# Altium schematic sheet HDMI_Sink.SchDoc
size A4; SheetNumber: 6; SheetTotal: 13
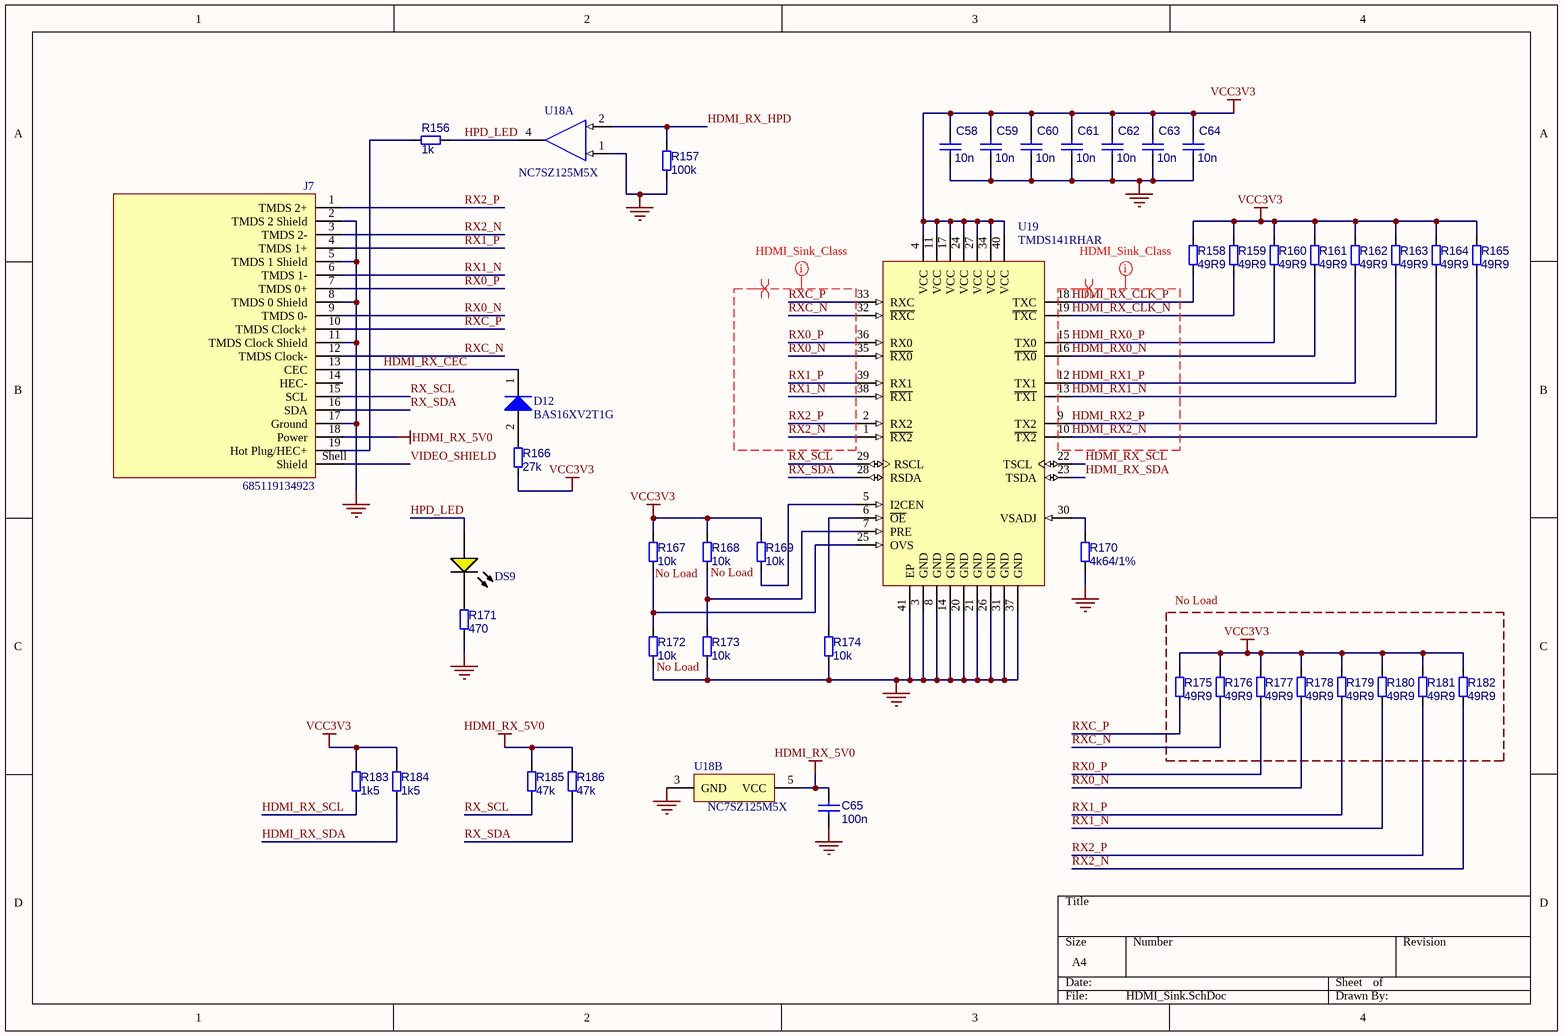
[diagram p0: HDMI_Sink.SchDoc]

## Parts
C58  10n  [CAPC1005X50N_0402]
C59  10n  [CAPC1005X50N_0402]
C60  10n  [CAPC1005X50N_0402]
C61  10n  [CAPC1005X50N_0402]
C62  10n  [CAPC1005X50N_0402]
C63  10n  [CAPC1005X50N_0402]
C64  10n  [CAPC1005X50N_0402]
C65  100n  [CAPC1005X50N_0402]
D12  BAS16XV2T1G  [ONSC-SOD-523-2-502-01_V]
DS9  19-217/Y5C-AM1N1VY/3T  [EVRL-0603-2_V]  (value not drawn)
J7  685119134923  [685119134923]
R156  1k  [R_0402]
R157  100k  [R_0402]
R158  49R9  [R_0402]
R159  49R9  [R_0402]
R160  49R9  [R_0402]
R161  49R9  [R_0402]
R162  49R9  [R_0402]
R163  49R9  [R_0402]
R164  49R9  [R_0402]
R165  49R9  [R_0402]
R166  27k  [R_0402]
R167  10k  [R_0402]
R168  10k  [R_0402]
R169  10k  [R_0402]
R170  4k64/1%  [R_0402]
R171  470  [R_0402]
R172  10k  [R_0402]
R173  10k  [R_0402]
R174  10k  [R_0402]
R175  49R9  [R_0402]
R176  49R9  [R_0402]
R177  49R9  [R_0402]
R178  49R9  [R_0402]
R179  49R9  [R_0402]
R180  49R9  [R_0402]
R181  49R9  [R_0402]
R182  49R9  [R_0402]
R183  1k5  [R_0402]
R184  1k5  [R_0402]
R185  47k  [R_0402]
R186  47k  [R_0402]
U18  NC7SZ125M5X  [FAIR-SOT23-5_V]  (parts A,B of 2)
U19  TMDS141RHAR  [RHA0040D_V]

## Blocks framed on the sheet
No Load: R175-R182

## Nets
GND: C58.1 C59.1 C60.1 C61.1 C62.1 C63.1 C64.1 C65.1 J7.2(TMDS_2_Shield) J7.5(TMDS_1_Shield) J7.8(TMDS_0_Shield) J7.11(TMDS_Clock_Shield) J7.17(Ground) R157.1 R170.1 R171.1 R172.1 R173.1 R174.1 U18.1(~{OE}) U18.3(GND) U19.3(GND) U19.8(GND) U19.14(GND) U19.20(GND) U19.21(GND) U19.26(GND) U19.31(GND) U19.37(GND) U19.41(EP)
HDMI_RX_5V0: C65.2 J7.18(Power) R185.2 R186.2 U18.5(VCC)
VCC3V3: C58.2 C59.2 C60.2 C61.2 C62.2 C63.2 C64.2 R158.2 R159.2 R160.2 R161.2 R162.2 R163.2 R164.2 R165.2 R166.1 R167.2 R168.2 R169.2 R175.2 R176.2 R177.2 R178.2 R179.2 R180.2 R181.2 R182.2 R183.2 R184.2 U19.4(VCC) U19.11(VCC) U19.17(VCC) U19.24(VCC) U19.27(VCC) U19.34(VCC) U19.40(VCC)
HDMI_RX0_N: R161.1 U19.16(~{TX0})
HDMI_RX0_P: R160.1 U19.15(TX0)
HDMI_RX1_N: R163.1 U19.13(~{TX1})
HDMI_RX1_P: R162.1 U19.12(TX1)
HDMI_RX2_N: R165.1 U19.10(~{TX2})
HDMI_RX2_P: R164.1 U19.9(TX2)
HDMI_RX_CEC: D12.1(K) J7.13(CEC)
HDMI_RX_CLK_N: R159.1 U19.19(~{TXC})
HDMI_RX_CLK_P: R158.1 U19.18(TXC)
HDMI_RX_HPD: R157.2 U18.2(A)
HDMI_RX_SCL: R183.1 U19.22(TSCL)
HDMI_RX_SDA: R184.1 U19.23(TSDA)
HPD_LED: DS9.1(A) R156.2 U18.4(Y)
RX0_N: J7.9(TMDS_0-) R178.1 U19.35(~{RX0})
RX0_P: J7.7(TMDS_0+) R177.1 U19.36(RX0)
RX1_N: J7.6(TMDS_1-) R180.1 U19.38(~{RX1})
RX1_P: J7.4(TMDS_1+) R179.1 U19.39(RX1)
RX2_N: J7.3(TMDS_2-) R182.1 U19.1(~{RX2})
RX2_P: J7.1(TMDS_2+) R181.1 U19.2(RX2)
RX_SCL: J7.15(SCL) R185.1 U19.29(RSCL)
RX_SDA: J7.16(SDA) R186.1 U19.28(RSDA)
RXC_N: J7.12(TMDS_Clock-) R176.1 U19.32(~{RXC})
RXC_P: J7.10(TMDS_Clock+) R175.1 U19.33(RXC)
VIDEO_SHIELD: J7.Shell(Shield)
NetD12_2: D12.2(A) R166.2
NetDS9_2: DS9.2(K) R171.2
NetJ7_19: J7.19(Hot_Plug/HEC+) R156.1
NetR167_1: R167.1 R172.2 U19.25(OVS)
NetR168_1: R168.1 R173.2 U19.7(PRE)
NetR169_1: R169.1 U19.5(I2CEN)
NetR170_2: R170.2 U19.30(VSADJ)
NetR174_2: R174.2 U19.6(~{OE})

Not connected (* = marked no-connect by the designer): J7 14(HEC-)

## Layout directives
net class HDMI_Sink_Class: HDMI_RX0_N, HDMI_RX0_P, HDMI_RX1_N, HDMI_RX1_P, HDMI_RX2_N, HDMI_RX2_P, HDMI_RX_CLK_N, HDMI_RX_CLK_P, RX0_N, RX0_P, RX1_N, RX1_P, RX2_N, RX2_P, RXC_N, RXC_P
differential pair: HDMI_RX0_N, HDMI_RX0_P, HDMI_RX1_N, HDMI_RX1_P, HDMI_RX2_N, HDMI_RX2_P, HDMI_RX_CLK_N, HDMI_RX_CLK_P, RX0_N, RX0_P, RX1_N, RX1_P, RX2_N, RX2_P, RXC_N, RXC_P

## Notes on the sheet
- No Load

## Library data of the parts
C58-C65 = CMP-001-00084-2: MLCC 0402
D12 = CMP-1054-00076-1: Switching Diode, 2-Pin SOD-523, Pb-Free, Tape and Reel; Manufacturer: On Semiconductor; trr Max (ns): 6; Configuration: Single; IF Max (A): 0.2; ComponentLink1URL: http://www.onsemi.com/; DatasheetVersion: Rev. 7; RoHS: TRUE; PackageVersion: Rev. E, 09/2010; Packing: Tape and Reel; ComponentLink2Description: Datasheet; ComponentLink2URL: http://www.onsemi.com/pub_link/Collateral/BAS16XV2T1-D.PDF; ComponentLink3Description: Package Specification; PackageReference: SOD-523-2-502-01; ComponentLink1Description: Manufacturer URL; PartNumber: BAS16XV2T1G; Mounting Technology: Surface Mount; PackageDescription: 2-Pin SOD, Body 1.2 x 0.8 mm; ComponentLink3URL: http://www.onsemi.com/pub_link/Collateral/502-01.PDF
DS9 = CMP-007-00005-2: Chip LED, Yellow, 5 V, 25mA, -40 to 85 degC, 2-Pin SMD (0603), RoHS, Tape and Reel; Manufacturer: Everlight Electronics; Datasheet Version: Rev. 1.0, 12/2005; Package Reference: 0603; Mounting Technology: SM; Package Description: 2-Pin Surface Mount Device, Body 1.6 x 0.8 mm; Case/Package: 0603; Datasheet URL: http://www.fairchip.com/pdf/Everlight/19-217-Y5C-AM1N1VY-3T.pdf; Manufacturer URL: http://www.everlight.com/; RoHS Compliant: False
J7 = CMP-1502-00169-4: HDMI Receptacle Connector 19 Position Surface Mount, Right Angle Through Hole; Contact Resistance: 30mΩ; Number of Contacts: 19; Current Rating: 500mA; Body Material: Plastic; Voltage Rating: 40V; Insulation Resistance: 10MΩ; Mount: Horizontal, Surface Mount; Connector Type: HDMI; Height: 6.28mm; Width: 15mm; Contact Material: Gold; Termination: SMD/SMT; Orientation: Horizontal; Min Operating Temperature: -25°C; RoHS: Compliant; Number of Pins: 19; REACH SVHC: Unknown; Features: Shielded; Packaging: Tape and Reel; Gender: Receptacle; Number of Positions: 19; Max Operating Temperature: 85°C; Length: 12.15mm; Color: Black
R156-R186 = CMP-009-00178-3: Chip 0402 resistor
U18 = CMP-2000-06816-1: TinyLogic UHS Buffer with Three-State Output, 1.65 to 5.5 V, -40 to 85 degC, 5-Pin SOT23, RoHS, Tape and Reel; Manufacturer: Fairchild Semiconductor; Input Signal Type: Single-Ended; Maximum Operating Supply Voltage: 5.5V; Number of Outputs per Chip: 1; Maximum Propagation Delay Time @ Maximum CL: 5.7@3.3V; Minimum Operating Supply Voltage: 1.65V; Maximum Quiescent Current: 2uA; Propagation Delay Test Condition: 50pF; Lead Finish: MatteTin; Number of Output Enables per Chip: 1Low; Maximum Low Level Output Current: 32mA; Output Type: 3-State; Package Version: 08/2015; Max Processing Temp: 260; Maximum High Level Output Current: -32mA; Tolerant I/Os: 5V; Bus Hold: No; Fabrication Technology: CMOS; Polarity: Non-Inverting; Typical Operating Supply Voltage: 1.8; Logic Function: Buffer/LineDriver; Manufacturer URL: https://www.fairchildsemi.com/; Mounting: SurfaceMount; Number of Channels per Chip: 1; Package Description: 5-Pin Small Outline Transistor, Body 2.9 x 1.6 mm, Pitch 0.95 mm; Package Reference: SOT23-5; Number of Elements per Chip: 1; Package URL: https://www.fairchildsemi.com/package-drawings/MA/MA05B.pdf; Datasheet URL: https://www.fairchildsemi.com/datasheets/NC/NC7SZ125.pdf; Datasheet Version: Rev. 1.0.5, 01/2014; Mounting Technology: SurfaceMount; Operating Temperature: -40to85C; Number of Inputs per Chip: 1
U19 = CMP-020-00027-1: 2.25-Gbps HDMI 1.3a TMDS redriver 40-VQFN 0 to 70; Min Supply Voltage: 3V; Max Supply Voltage: 3.6V; Max Operating Temperature: 70°C; Pins: 40; Case/Package: VQFN; Min Operating Temperature: 0°C